# Altium schematic sheet Logic.SchDoc
size 177 x 254 mm
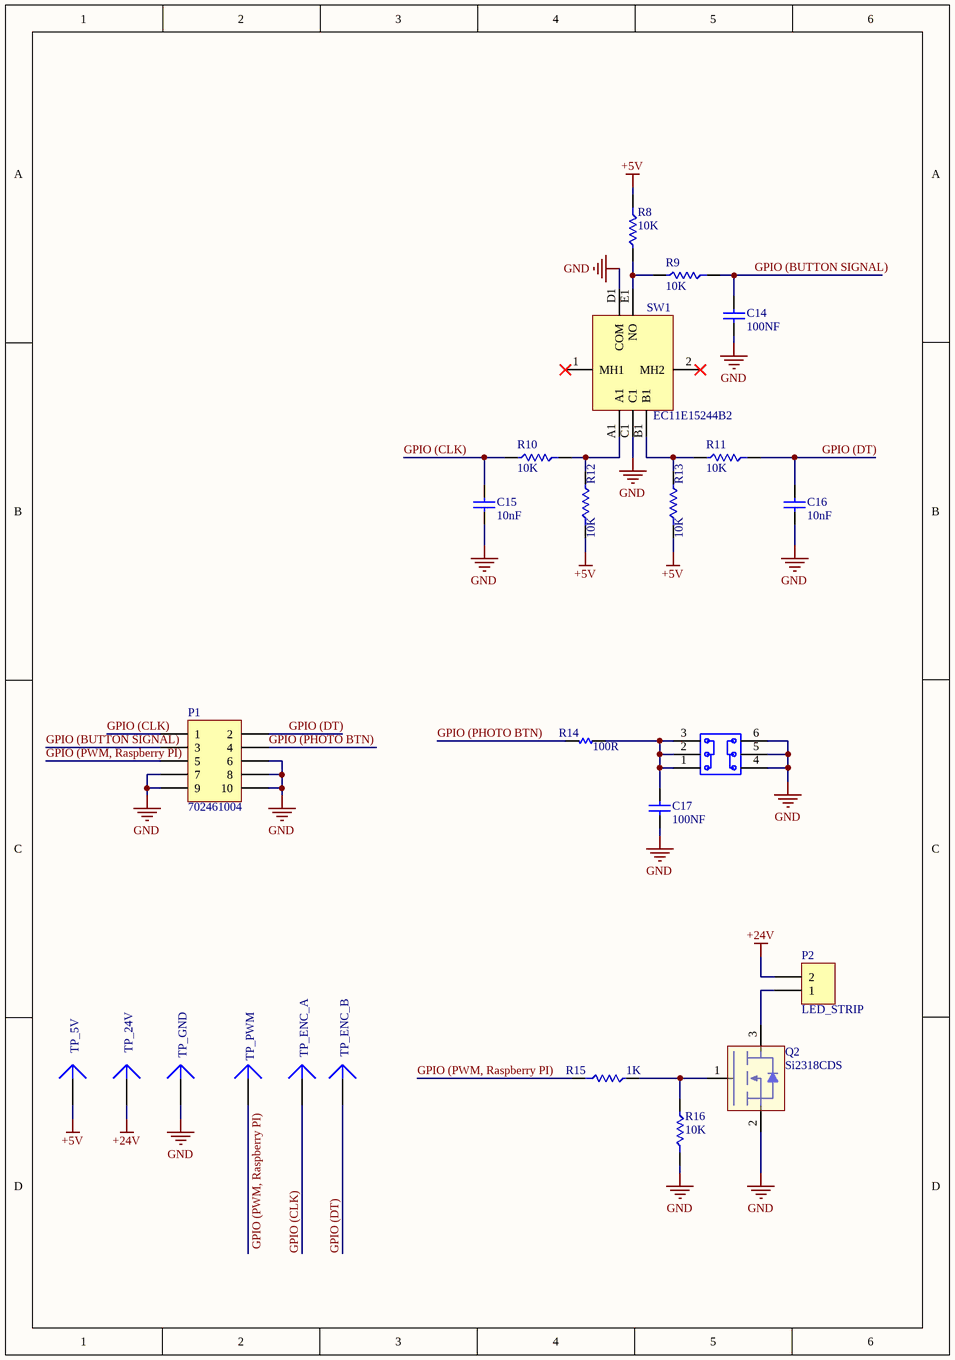
[diagram p0: Logic.SchDoc]

## Parts
C14  100NF  [CAP 0402/1005]
C15  10nF  [CAP 0402/1005]
C16  10nF  [CAP 0402/1005]
C17  100NF  [CAP 0402/1005]
P1  702461004  [CONN_7024610xx_MOL]
P2  LED_STRIP  [LED-STRIP]
Q2  Si2318CDS  [SOT23]
R8  10K  [RES 0402/1005]
R9  10K  [RES 0402/1005]
R10  10K  [RES 0402/1005]
R11  10K  [RES 0402/1005]
R12  10K  [RES 0402/1005]
R13  10K  [RES 0402/1005]
R14  100R  [CAP 0402/1005]
R15  1K  [CAP 0603/1608]
R16  10K  [RES 0402/1005]
SW1  EC11E15244B2  [EC11E15244B2]
SW2  PS-7054DVB-6PN  [SW-TH_6P-L7.0-W7.0-P2.00]  (value not drawn)
TP_5V  (no value)  [TP_SMD]  (no BOM)
TP_24V  (no value)  [TP_SMD]  (no BOM)
TP_ENC_A  (no value)  [TP_SMD]  (no BOM)
TP_ENC_B  (no value)  [TP_SMD]  (no BOM)
TP_GND  (no value)  [TP_SMD]  (no BOM)
TP_PWM  (no value)  [TP_SMD]  (no BOM)

## Nets
+5V: R8.1 R12.1 R13.1 TP_5V.1
+24V: P2.2 TP_24V.1
GND: C14.1 C15.1 C16.1 C17.1 P1.6 P1.7 P1.8 P1.9 P1.10 Q2.2 R16.1 SW1.C1 SW1.D1(COM) SW2.4 SW2.5 SW2.6 TP_GND.1
GPIO (BUTTON SIGNAL): C14.2 P1.3 R9.1
GPIO (CLK): C15.2 P1.1 R10.2 TP_ENC_A.1
GPIO (DT): C16.2 P1.2 R11.1 TP_ENC_B.1
GPIO (PHOTO BTN): P1.4 R14.1
GPIO (PWM, Raspberry PI): P1.5 R15.1 TP_PWM.1
NetC17_2: C17.2 R14.2 SW2.1 SW2.2 SW2.3
NetP2_1: P2.1 Q2.3
NetQ2_1: Q2.1 R15.2 R16.2
NetR8_2: R8.2 R9.2 SW1.E1(NO)
NetR10_1: R10.1 R12.2 SW1.A1
NetR11_2: R11.2 R13.2 SW1.B1

Not connected (* = marked no-connect by the designer): SW1 1(MH1)* 2(MH2)*

## Library data of the parts
C14 C17 = 100NF: 50V 100nF X7R ±10% 0402 Multilayer Ceramic Capacitors MLCC - SMD/SMT ROHS; Manufacturer: muRata; MPN: GRM155R71H104KE14D; Value: 2.2nF; SPN: C77020; Package: 0402 (1005 Metric); Supplier: LCSC; Operating Temperature: -55°C ~ 125°C
C15 C16 = 10nF: 50V 10nF X7R ±10% 0402 Multilayer Ceramic Capacitors MLCC - SMD/SMT ROHS; Manufacturer: YAGEO; MPN: CC0402KRX7R9BB103; SPN: C60133; Value: 10nF; Package: 0402 (1005 Metric); Supplier: LCSC; Operating Temperature: -55°C ~ 125°C
P1 = Header 5X2: -55℃~+120℃ 10P 2 2.54mm 2.5A 250V 2x5P 5 Brass Gold Through Hole UL94V-0 Plugin,P=2.54mm Wire To Board Connector ROHS; SPN: C588426; MF: MOLEX; MPN: 702461004
P2 = LED_STRIP: Through Hole,P=2.54mm; Manufacturer: DORABO; Manufacturer Part Number: DB125-2.54-2P-GN-S; Package: TH; Supplier: LCSC; Supplier Part Number: C918120; Value: LED_STRIP
Q2 = Si2318CDS: MOSFET N-CH 40V 5.6A SOT-23; Manufacturer: VISHAY; Manufacturer Part Number: Si2318CDS-T1-GE3; Package: SOT-23; Supplier Part Number: C14498; Supplier: LCSC; Value: Si2318CDS
R8-R13 R16 = 10K: 62.5mW Thick Film Resistors 50V ±1% 10kΩ 0402 Chip Resistor - Surface Mount ROHS; Manufacturer: VO; MPN: SCR0402F10K; SPN: C3015825; Package: 0402 (1005 Metric); Value: 10K; Supplier: LCSC; Operating Temperature: -55°C ~ 155°C; Supplier Availability: Active
R14 = 100R/0402: RES 100Ω ±1% 62.5mW 0402; Manufacturer Part Number: RC0402FR-07100RL; Manufacturer: Yageo; package: 0402; Supplier: LCSC; Supplier Part Number: C106232; Temperature: -55 to 155; value: 100R
R15 = 1K-0603: RES 1kΩ ±1% 100mW 0603; Manufacturer: YAGEO; Manufacturer Part Number: RC0603FR-071KL; Package: 0603; Supplier Part Number: C22548; Value: 1K; Supplier: LCSC; Operating Temperature: -55°C ~ 155°C; Supplier Availability: Active
SW1 = EC11E15244B2: Through Hole Encoders RoHS; MF: ALPS Electric; LCSC: C470754; MPN: EC11E15244B2; Package: https://tech.alpsalpine.com/e/products/detail/EC11E15244B2/
SW2 = PS-7054DVB-6PN: SWITCH PUSH 500mA 24V; SPN: C22363820; MF: G-Switch(品赞); MPN: PS-7054DVB-6PN; Package: 6P,7x7mm; Supplier: LCSC
TP_5V TP_24V TP_ENC_A TP_ENC_B TP_GND TP_PWM = TP-SMD: Test Pin